# Altium schematic sheet 1_P1.schdoc
size 307 x 218 mm; Symbol: Drawing-Symbol_A4; Device: Drawing-Symbol_A4; Company: 嘉立创EDA; Version: V1.0; Page Size: A4; @Project Name: stm32f4; @Page Count: 1; @Update Date: 2025-11-04; @Create Date: 2025-11-02; @Schematic Name: Schematic2; @Page No: 1; @Page Name: P1; @Create Time: 13:52:45; @Update Time: 18:32:44; Width: 1170; Height: 825; Region Start: 1; X Region Count: 6; Y Region Count: 4; Blade Width: 10; Title Block Position: 3; @Board Name: ADC
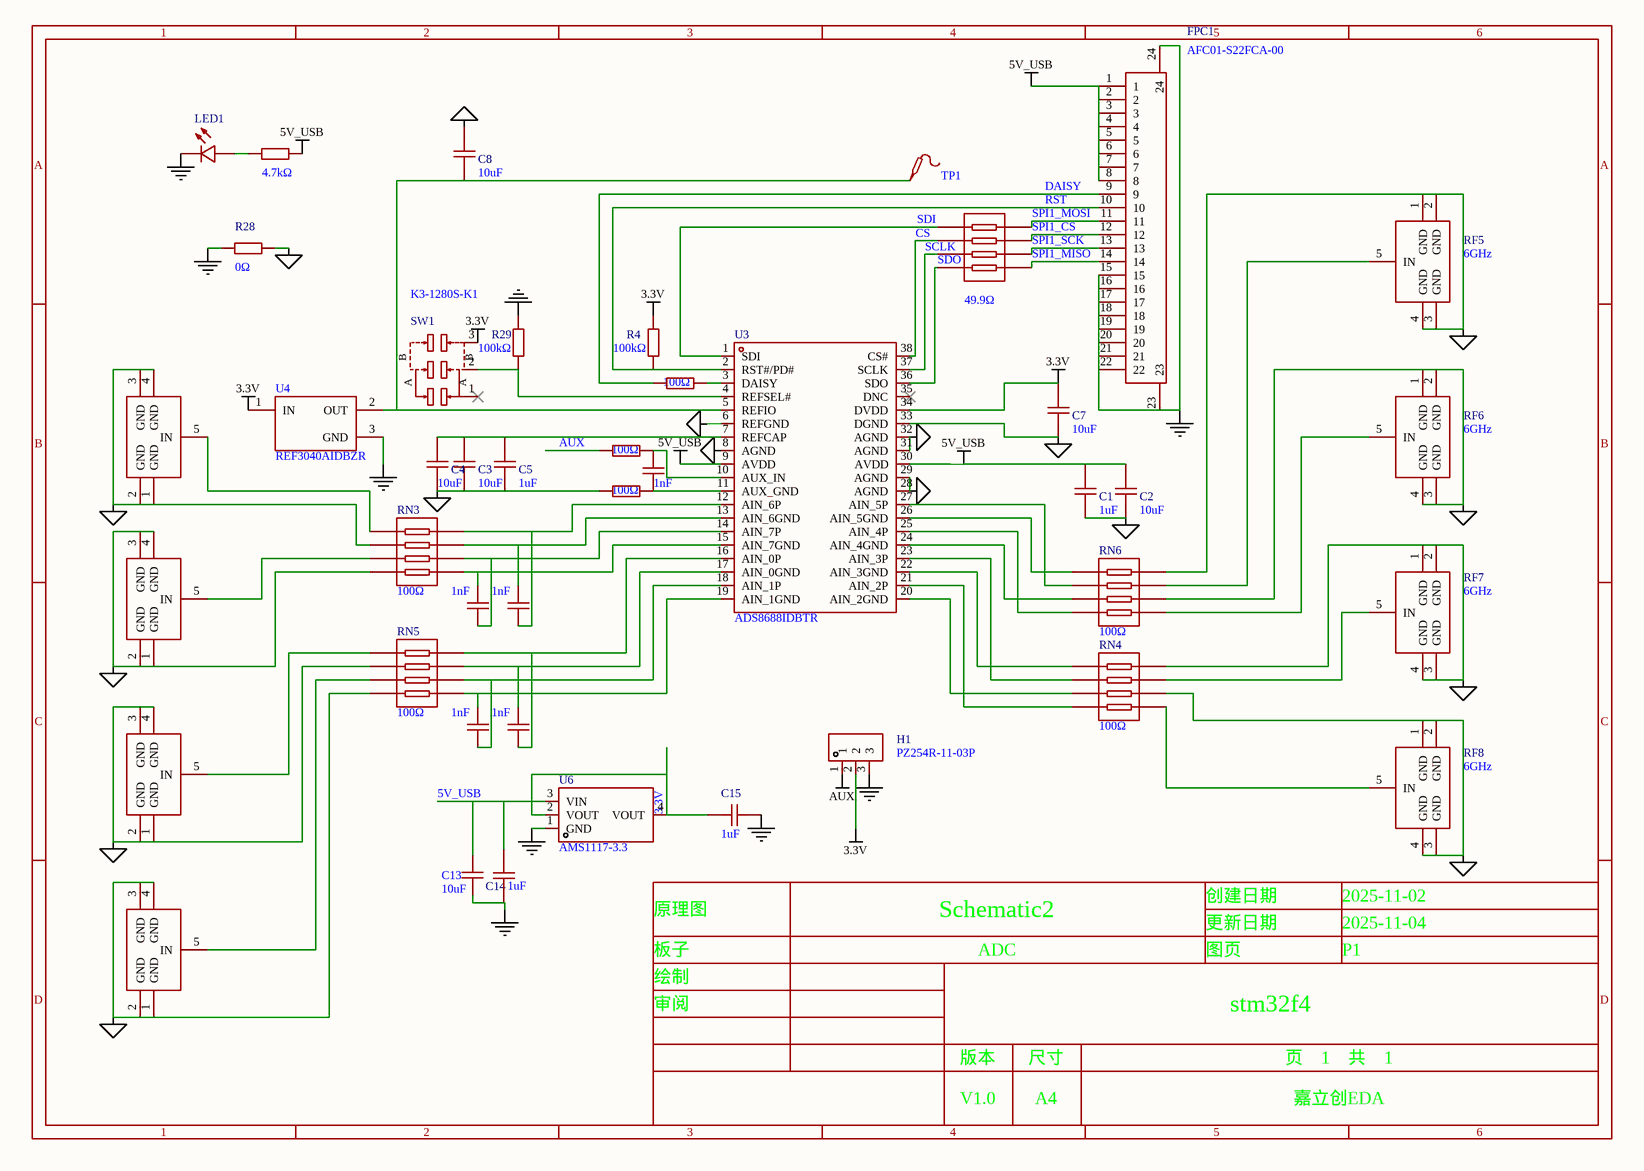
[diagram p0: 1_P1.schdoc]

## Parts
C1  1uF  [C0603]
C2  10uF  [C0603]
C3  10uF  [C0603]
C4  10uF  [C0603]
C5  1uF  [C0603]
C6  1nF  [C0603]
C7  10uF  [C0603]
C8  10uF  [C0603]
C9  1nF  [C0603]
C10  1nF  [C0603]
C11  1nF  [C0603]
C12  1nF  [C0603]
C13  10uF  [C0603]
C14  1uF  [C0603]
C15  1uF  [C0603]
FPC1  AFC01-S22FCA-00  [FPC-SMD_P0.5-22P_FGS-XJ-H2.0]
H1  PZ254R-11-03P  [HDR-TH_3P-P2.54-H-M-W10.4]
LED1  19-217/R6C-AL1M2VY/3T  [LED0603-RD]  (value not drawn)
R1  100Ω  [R0603]
R3  100Ω  [R0603]
R4  100kΩ  [R0603]
R26  4.7kΩ  [R0402]
R28  0Ω  [R0603]
R29  100kΩ  [R0603]
R30  100Ω  [R0603]
RF1  6GHz  [ANT-TH_KH-SMA-K513-G]  (value not drawn)
RF2  6GHz  [ANT-TH_KH-SMA-K513-G]  (value not drawn)
RF3  6GHz  [ANT-TH_KH-SMA-K513-G]  (value not drawn)
RF4  6GHz  [ANT-TH_KH-SMA-K513-G]  (value not drawn)
RF5  6GHz  [ANT-TH_KH-SMA-K513-G]
RF6  6GHz  [ANT-TH_KH-SMA-K513-G]
RF7  6GHz  [ANT-TH_KH-SMA-K513-G]
RF8  6GHz  [ANT-TH_KH-SMA-K513-G]
RN3  100Ω  [RES-ARRAY-SMD_0603-8P-L3.2-W1.6-BL]
RN4  100Ω  [RES-ARRAY-SMD_0603-8P-L3.2-W1.6-BL]
RN5  100Ω  [RES-ARRAY-SMD_0603-8P-L3.2-W1.6-BL]
RN6  100Ω  [RES-ARRAY-SMD_0603-8P-L3.2-W1.6-BL]
RN7  49.9Ω  [RES-ARRAY-SMD_0402-8P-L2.0-W1.0-BL]
SW1  K3-1280S-K1  [SW-SMD_K3-1280S-K1]
TP1  (no value)  [Test-Point-0.5mm]
U3  ADS8688IDBTR  [TSSOP-38_L9.7-W4.4-P0.50-LS6.4-BL]
U4  REF3040AIDBZR  [SOT-23-3_L2.9-W1.6-P1.90-LS2.8-BR]
U6  AMS1117-3.3  [SOT-223-3_L6.5-W3.4-P2.30-LS7.0-BR]

## Nets
3.3V: C7.1 C15.1 H1.2 R4.2 SW1.3 U3.34(DVDD) U4.1(IN) U6.2(VOUT) U6.4(VOUT)
5V_USB: C1.1 C2.1 C13.2 C14.2 FPC1.1 FPC1.2 FPC1.3 FPC1.4 FPC1.5 FPC1.6 FPC1.7 FPC1.8 R26.2 U3.9(AVDD) U3.30(AVDD) U6.3(VIN)
AGND: C1.2 C2.2 C3.1 C4.1 C5.2 C7.2 C8.1 R1.1 R28.2 RF1.1(GND) RF1.2(GND) RF1.3(GND) RF1.4(GND) RF2.1(GND) RF2.2(GND) RF2.3(GND) RF2.4(GND) RF3.1(GND) RF3.2(GND) RF3.3(GND) RF3.4(GND) RF4.1(GND) RF4.2(GND) RF4.3(GND) RF4.4(GND) RF5.1(GND) RF5.2(GND) RF5.3(GND) RF5.4(GND) RF6.1(GND) RF6.2(GND) RF6.3(GND) RF6.4(GND) RF7.1(GND) RF7.2(GND) RF7.3(GND) RF7.4(GND) RF8.1(GND) RF8.2(GND) RF8.3(GND) RF8.4(GND) RN3.6 RN3.8 RN4.2 RN4.4 RN5.6 RN5.8 RN6.2 RN6.4 U3.6(REFGND) U3.8(AGND) U3.28(AGND) U3.29(AGND) U3.31(AGND) U3.32(AGND) U3.33(DGND)
AUX: H1.1 R30.1
GND: C13.1 C14.1 C15.2 FPC1.15 FPC1.16 FPC1.17 FPC1.18 FPC1.19 FPC1.20 FPC1.21 FPC1.22 FPC1.23 FPC1.24 H1.3 LED1.1(C) R28.1 R29.2 U4.3(GND) U6.1(GND)
CS: RN7.2 U3.38(CS#)
DAISY: FPC1.9 R3.1
RST: FPC1.10 R4.1 U3.2(RST#/PD#)
SCLK: RN7.3 U3.37(SCLK)
SDI: RN7.1 U3.1(SDI)
SDO: RN7.4 U3.36(SDO)
SPI1_CS: FPC1.12 RN7.7
SPI1_MISO: FPC1.14 RN7.5
SPI1_MOSI: FPC1.11 RN7.8
SPI1_SCK: FPC1.13 RN7.6
NetC3_2: C3.2 C4.2 C5.1 U3.7(REFCAP)
NetC6_1: C6.1 R1.2 U3.11(AUX_GND)
NetC6_2: C6.2 R30.2 U3.10(AUX_IN)
NetC8_2: C8.2 TP1.1 U3.5(REFIO) U4.2(OUT)
NetC9_1: C9.1 RN3.1 U3.15(AIN_7GND)
NetC9_2: C9.2 RN3.2 U3.14(AIN_7P)
NetC10_1: C10.1 RN3.3 U3.13(AIN_6GND)
NetC10_2: C10.2 RN3.4 U3.12(AIN_6P)
NetC11_1: C11.1 RN5.1 U3.19(AIN_1GND)
NetC11_2: C11.2 RN5.2 U3.18(AIN_1P)
NetC12_1: C12.1 RN5.3 U3.17(AIN_0GND)
NetC12_2: C12.2 RN5.4 U3.16(AIN_0P)
NetLED1_2: LED1.2(A) R26.1
NetR3_2: R3.2 U3.3(DAISY)
NetR29_1: R29.1 SW1.2 U3.4(REFSEL#)
NetRF1_5: RF1.5(IN) RN3.5
NetRF2_5: RF2.5(IN) RN3.7
NetRF3_5: RF3.5(IN) RN5.5
NetRF4_5: RF4.5(IN) RN5.7
NetRF5_5: RF5.5(IN) RN6.3
NetRF6_5: RF6.5(IN) RN6.1
NetRF7_5: RF7.5(IN) RN4.3
NetRF8_5: RF8.5(IN) RN4.1
NetRN4_5: RN4.5 U3.22(AIN_3GND)
NetRN4_6: RN4.6 U3.23(AIN_3P)
NetRN4_7: RN4.7 U3.20(AIN_2GND)
NetRN4_8: RN4.8 U3.21(AIN_2P)
NetRN6_5: RN6.5 U3.26(AIN_5GND)
NetRN6_6: RN6.6 U3.27(AIN_5P)
NetRN6_7: RN6.7 U3.24(AIN_4GND)
NetRN6_8: RN6.8 U3.25(AIN_4P)

Not connected (* = marked no-connect by the designer): SW1 1*; U3 35(DNC)*

## Notes on the sheet
- 1
- 2
- 3
- 4
- 5
- 6
- A
- B
- C
- 原理图
- Schematic2
- 创建日期
- 更新日期
- 2025-11-02
- 2025-11-04
- 板子
- 绘制
- ADC
- 图页
- P1
- D
- 审阅
- 版本
- 尺寸
- stm32f4
- 页    1    共    1
- V1.0
- A4
- 嘉立创EDA
- (in symbol K3-1280S-K1) B; A

## Library data of the parts
C1 C5 C14 C15 = CL10A105KB8NNNC: Manufacturer: SAMSUNG(三星); Add into BOM: yes; Tolerance: ±10%; Voltage Rating: 50V; Temperature Coefficient: X5R; Symbol: CL10A105KB8NNNC; Device: CL10A105KB8NNNC; LCSC Part Name: 1uF ±10% 50V; Supplier Part: C15849; Manufacturer Part: CL10A105KB8NNNC; Supplier Footprint: 0603; JLCPCB Part Class: 基础库; Datasheet: https://item.szlcsc.com/datasheet/CL10A105KB8NNNC/16531.html; Supplier: LCSC; Convert to PCB: yes; Value: 1uF
C2-C4 C7 C8 = 0603X106M250NT: Manufacturer: FH(风华); Add into BOM: yes; Tolerance: ±20%; Voltage Rating: 25V; Temperature Coefficient: X5R; Symbol: 0603X106M250NT; Device: 0603X106M250NT; LCSC Part Name: 10uF ±20% 25V; Supplier Part: C479655; Manufacturer Part: 0603X106M250NT; Supplier Footprint: 0603; JLCPCB Part Class: 扩展库; Datasheet: https://atta.szlcsc.com/upload/public/pdf/source/20200305/C486355_26A10D38EF8C2A5C37091D0039909270.pdf; Supplier: LCSC; Convert to PCB: yes; Value: 10uF
C6 C9-C12 = CL10B102KB8NNNC: Manufacturer: SAMSUNG(三星); Add into BOM: yes; Tolerance: ±10%; Voltage Rating: 50V; Temperature Coefficient: X7R; Symbol: CL10B102KB8NNNC; Device: CL10B102KB8NNNC; LCSC Part Name: 1nF ±10% 50V; Supplier Part: C1588; Manufacturer Part: CL10B102KB8NNNC; Supplier Footprint: 0603; JLCPCB Part Class: 基础库; Datasheet: https://item.szlcsc.com/datasheet/CL10B102KB8NNNC/1940.html; Supplier: LCSC; Convert to PCB: yes; Value: 1nF
C13 = 0603X106K100NT: Manufacturer: FH(风华); Add into BOM: yes; Tolerance: ±10%; Voltage Rated: 10V; Temperature Coefficient: X5R; Symbol: 0603X106K100NT; Device: 0603X106K100NT; LCSC Part Name: 10uF ±10% 10V; Supplier Part: C38898; Manufacturer Part: 0603X106K100NT; Supplier Footprint: 0603; Datasheet: https://atta.szlcsc.com/upload/public/pdf/source/20170923/C38898_1506149449306988751.pdf; Supplier: LCSC; Convert to PCB: yes; Value: 10uF
FPC1 = AFC01-S22FCA-00: Manufacturer: JS(钜硕电子); Add into BOM: yes; Locking Feature: 翻盖式; Number of Contacts: 22P; Pitch: 0.5mm; FFC, FCB Thickness: 0.3mm; Symbol: AFC01-S22FCA-00; Device: AFC01-S22FCA-00; LCSC Part Name: 间距:0.5mm P数:22P 翻盖式 下接; Supplier Part: C262668; Manufacturer Part: AFC01-S22FCA-00; Supplier Footprint: SMD,P=0.5mm,卧贴; JLCPCB Part Class: 扩展库; Datasheet: https://atta.szlcsc.com/upload/public/pdf/source/20190816/C413942_2A72D1AC756EAE17EEDF756A339D4500.pdf; Supplier: LCSC; Convert to PCB: yes; Contact Type: 下接; Mounting Type: 卧贴; Height Above Board: 2mm
H1 = PZ254R-11-03P: Manufacturer: XFCN(兴飞); Add into BOM: yes; Pin Structure: 1x3P; Pitch: 2.54mm; Circluar Pins/Square Pins: 方针; Symbol: PZ254R-11-03P; Device: PZ254R-11-03P; LCSC Part Name: 1x3P 间距:2.54mm 方针 弯插; Supplier Part: C492411; Manufacturer Part: PZ254R-11-03P; Supplier Footprint: 弯插,P=2.54mm; JLCPCB Part Class: 扩展库; Datasheet: https://item.szlcsc.com/datasheet/PZ254R-11-03P/502967.html; Supplier: LCSC; Convert to PCB: yes; Row Spacing: -; Mounting Type: 弯插; Number of Rows: 单排; Number of Pins: 3P; Current Rating: -; Voltage Rating (Max): -; Length of Mating Pin: 6mm; Insulation Height: 2.5mm; Contact Material: 黄铜; Contact Plating: -; Operating Temperature: -40℃~+105℃; Color: 黑色
LED1 = 19-217/R6C-AL1M2VY/3T: Manufacturer: EVERLIGHT(亿光); Add into BOM: yes; Illumination Color: 红色; Voltage - Forward(Vf): 1.95V; Power(Watts): 60mW; Forward Current: 5mA; Wavelength - Dominant: 617.5nm; Peak Wavelength: 632nm; Lens Color: 无色透明透镜; Viewing Angle: 120°; Symbol: 19-217/R6C-AL1M2VY/3T; Device: 19-217/R6C-AL1M2VY/3T; LCSC Part Name: 红灯 停产; Supplier Part: C72044; Manufacturer Part: 19-217/R6C-AL1M2VY/3T; Supplier Footprint: 0603; JLCPCB Part Class: 扩展库; Supplier: LCSC; Convert to PCB: yes; Diode Configuration: -; Color Temperature: -; Mounting Style: -; Operating Temperature: -40℃~+85℃
R1 R3 R30 = 0603WAF1000T5E: Manufacturer: UNI-ROYAL(厚声); Add into BOM: yes; Tolerance: ±1%; Power(Watts): 100mW; Overload Voltage (Max): 75V; Temperature Coefficient: ±200ppm/℃; Symbol: 0603WAF1000T5E; Device: 0603WAF1000T5E; LCSC Part Name: 100Ω ±1% 100mW 厚膜电阻; Supplier Part: C22775; Manufacturer Part: 0603WAF1000T5E; Supplier Footprint: 0603; JLCPCB Part Class: 基础库; Datasheet: https://atta.szlcsc.com/upload/public/pdf/source/20200306/C422600_1E6D84923E4A46A82E41ADD87F860B5C.pdf; Supplier: LCSC; Convert to PCB: yes; Type: 厚膜电阻; Value: 100Ω; Operating Temperature Range: -55℃~+155℃
R4 R29 = 0603WAF1003T5E: Manufacturer: UNI-ROYAL(厚声); Add into BOM: yes; Tolerance: ±1%; Power(Watts): 100mW; Voltage-Supply(Max): 75V; Temperature Coefficient: ±100ppm/℃; Symbol: 0603WAF1003T5E; Device: 0603WAF1003T5E; LCSC Part Name: 100kΩ ±1% 100mW 厚膜电阻; Supplier Part: C25803; Manufacturer Part: 0603WAF1003T5E; Supplier Footprint: 0603; JLCPCB Part Class: 基础库; Datasheet: https://item.szlcsc.com/datasheet/0603WAF1003T5E/26546.html; Supplier: LCSC; Convert to PCB: yes; Type: 厚膜电阻; Value: 100kΩ; Operating Temperature: -55℃~+155℃
R26 = 0402WGF4701TCE: Manufacturer: UNI-ROYAL(厚声); Add into BOM: yes; Tolerance: ±1%; Power(Watts): 62.5mW; Voltage-Supply(Max): 50V; Temperature Coefficient: ±100ppm/℃; Symbol: 0402WGF4701TCE; Device: 0402WGF4701TCE; LCSC Part Name: 4.7kΩ ±1% 62.5mW 厚膜电阻; Supplier Part: C25900; Manufacturer Part: 0402WGF4701TCE; Supplier Footprint: 0402; JLCPCB Part Class: 基础库; Datasheet: https://item.szlcsc.com/datasheet/0402WGF4701TCE/26643.html; Supplier: LCSC; Convert to PCB: yes; Type: 厚膜电阻; Value: 4.7kΩ; Operating Temperature: -55℃~+155℃
R28 = 0603WAF0000T5E: Manufacturer: UNI-ROYAL(厚声); Add into BOM: yes; Tolerance: ±1%; Power(Watts): 100mW; Voltage-Supply(Max): 75V; Symbol: 0603WAF0000T5E; Device: 0603WAF0000T5E; LCSC Part Name: 0Ω ±1% 100mW 厚膜电阻; Supplier Part: C21189; Manufacturer Part: 0603WAF0000T5E; Supplier Footprint: 0603; JLCPCB Part Class: 基础库; Datasheet: https://item.szlcsc.com/datasheet/0603WAF0000T5E/21903.html; Supplier: LCSC; Convert to PCB: yes; Type: 厚膜电阻; Value: 0Ω; Temperature Coefficient: -; Operating Temperature: -55℃~+155℃
RF1-RF8 = KH-SMA-K513-G: Manufacturer: kinghelm(金航标); Add into BOM: yes; Connector Type: 板端; Interface: 内孔; Number of Ports: 1; RF Series: SMA; Impedance: 50Ω; Style: 弯头; Symbol: KH-SMA-K513-G; Device: KH-SMA-K513-G; LCSC Part Name: SMA 内孔 弯头; Supplier Part: C411575; Manufacturer Part: KH-SMA-K513-G; Supplier Footprint: 插件; JLCPCB Part Class: 扩展库; Datasheet: https://item.szlcsc.com/datasheet/KH-SMA-K513-G/402832.html; Supplier: LCSC; Convert to PCB: yes; Interface Diameter: -; Interface Length/Height: -; Value: 6GHz; Operating Temperature Range: -55℃~+155℃
RN3-RN6 = YC164-FR-07100RL: Manufacturer: YAGEO(国巨); Add into BOM: yes; Number of Resistors: 4; Tolerance: ±1%; Power(Watts): 62.5mW; Temperature Coefficient: ±200ppm/℃; Symbol: YC164-FR-07100RL; Device: YC164-FR-07100RL; LCSC Part Name: 100Ω ±1%; Supplier Part: C136838; Manufacturer Part: YC164-FR-07100RL; Supplier Footprint: 0603x4; JLCPCB Part Class: 扩展库; Datasheet: https://item.szlcsc.com/datasheet/YC164-FR-07100RL/148154.html; Supplier: LCSC; Convert to PCB: yes; Value: 100Ω; Number of Pins: 8
RN7 = YC124-FR-0749R9L: Manufacturer: YAGEO(国巨); Add into BOM: yes; Number of Resistors: 4; Tolerance: ±1%; Power(Watts): 62.5mW; Temperature Coefficient: ±200ppm/℃; Symbol: YC124-FR-0749R9L; Device: YC124-FR-0749R9L; LCSC Part Name: 49.9Ω ±1%; Supplier Part: C136850; Manufacturer Part: YC124-FR-0749R9L; Supplier Footprint: 0402x4; JLCPCB Part Class: 扩展库; Datasheet: https://item.szlcsc.com/datasheet/YC124-FR-0749R9L/148166.html; Supplier: LCSC; Convert to PCB: yes; Value: 49.9Ω; Number of Pins: 8
SW1 = K3-1280S-K1: Manufacturer: 韩国韩荣; Add into BOM: yes; Circuit: 单刀双掷; Actuator Style: 矩形柱状; Switch Height: 3.5mm; Actuator Color: 黑色; Current Rating: 300mA; Voltage Rating: 6V; Life: 1万次; Symbol: K3-1280S-K1; Device: K3-1280S-K1; LCSC Part Name: 卧贴双档 滑动开关; Supplier Part: C128953; Manufacturer Part: K3-1280S-K1; Supplier Footprint: SMD,9.1x3.7mm; JLCPCB Part Class: 扩展库; Datasheet: https://item.szlcsc.com/datasheet/K3-1280S-K1/140239.html; Supplier: LCSC; Convert to PCB: yes; Termination Style: 鸥翼型; Length: 9.1mm; Width: 3.7mm; Mounting Type: 卧贴; Operating Temperature: -25℃~+80℃
TP1 = Test-Point: Add into BOM: yes; Symbol: Test-Point; Device: Test-Point; Convert to PCB: yes
U3 = ADS8688IDBTR: Manufacturer: TI(德州仪器); Add into BOM: yes; Resolution(Bits): 16位; Sampling Rate: 500kHz; number of channels: 8; Voltage - Supply: 5V; Interface: SPI; differential input: 否; Integral non - linearity: 0.75LSB; Signal-to-Noise Ratio: 92dB; Clock Frequency: 17MHz; Voltage Reference: 内置; Voltage Reference Drift: 6ppm/℃; ADC architecture: SAR; Full-Scale Range(FSR): 10.24V; Symbol: ADS8688IDBTR; Device: ADS8688IDBTR; LCSC Part Name: 具有双极性输入范围的单电源、16bit 、500 kSPS、4通道和8通道SAR（SAR）ADC; Supplier Part: C527390; Manufacturer Part: ADS8688IDBTR; Supplier Footprint: TSSOP-38-4.4mm; JLCPCB Part Class: 扩展库; Datasheet: https://www.ti.com/cn/lit/gpn/ads8684; Supplier: LCSC; Convert to PCB: yes; Operating Temperature: -40℃~+125℃
U4 = REF3040AIDBZR: Manufacturer: TI(德州仪器); Add into BOM: yes; Symbol: REF3040AIDBZR; Device: REF3040AIDBZR; LCSC Part Name: REF3040AIDBZR; Supplier Part: C19415; Manufacturer Part: REF3040AIDBZR; Supplier Footprint: SOT-23(SOT-23-3); JLCPCB Part Class: Extended Part; Datasheet: https://atta.szlcsc.com/upload/public/pdf/source/20130925/1457706650762.pdf; Supplier: LCSC; Convert to PCB: yes
U6 = AMS1117-3.3_C6186: Manufacturer: AMS; Add into BOM: yes; Output Type: 固定; Voltage - Supply: 16V; Output Voltage: 3.3V; Output Current: 1A; Power Supply Rejection Ratio (PSRR): 72dB@(120Hz); Voltage Dropout: 1.1V@(800mA); standby current: 5mA; Noise: 0.003%Vout; Output Configuration: 正极; Number of Outputs: 1; Symbol: AMS1117-3.3; Device: AMS1117-3.3_C6186; LCSC Part Name: 输出3.3V 1A; Supplier Part: C6186; Manufacturer Part: AMS1117-3.3; Supplier Footprint: SOT-223; JLCPCB Part Class: 基础库; Datasheet: https://item.szlcsc.com/datasheet/AMS1117-3.3/6652.html; Supplier: LCSC; Convert to PCB: yes; Features: 过流保护；过热保护; Operating Temperature: -40℃~+125℃